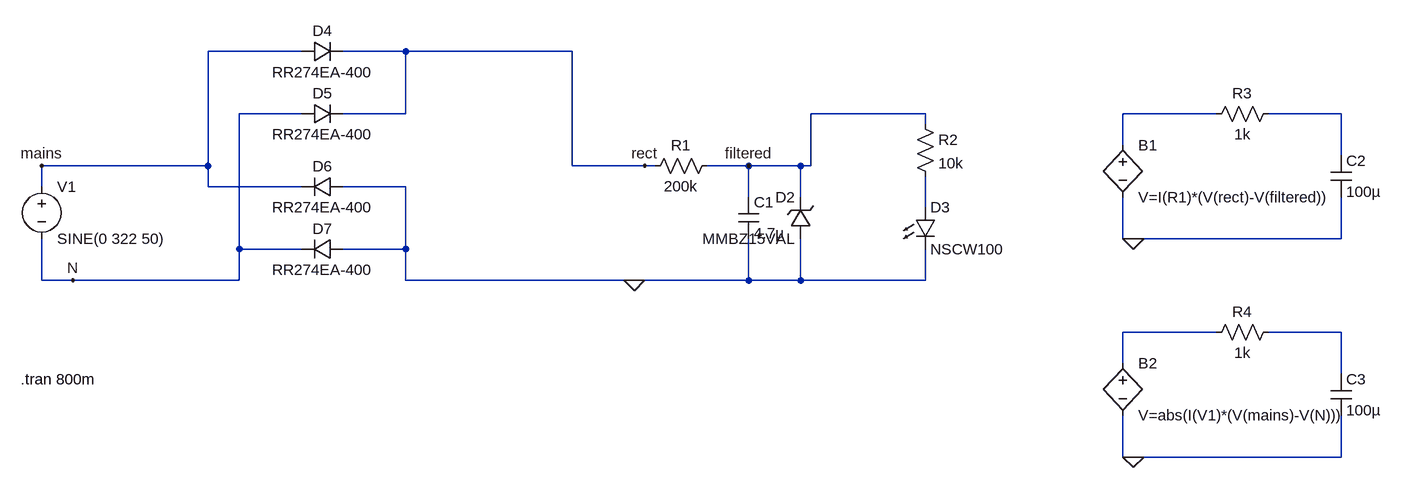
[diagram p0: schematic led_indicator_230v.asc]
led_indicator_230v.asc, the LTspice schematic file:
Version 4
SHEET 1 1312 680
WIRE -352 -80 -496 -80
WIRE -192 -80 -288 -80
WIRE 64 -80 -192 -80
WIRE -352 16 -448 16
WIRE -192 16 -192 -80
WIRE -192 16 -288 16
WIRE 608 16 432 16
WIRE 1056 16 912 16
WIRE 1248 16 1136 16
WIRE 608 32 608 16
WIRE 912 64 912 16
WIRE 1248 80 1248 16
WIRE -496 96 -496 -80
WIRE -496 96 -752 96
WIRE 64 96 64 -80
WIRE 176 96 64 96
WIRE 192 96 176 96
WIRE 336 96 272 96
WIRE 416 96 336 96
WIRE 432 96 432 16
WIRE 432 96 416 96
WIRE -752 128 -752 96
WIRE -496 128 -496 96
WIRE -352 128 -496 128
WIRE -192 128 -288 128
WIRE 336 144 336 96
WIRE 416 144 416 96
WIRE 608 160 608 112
WIRE 912 208 912 144
WIRE 928 208 912 208
WIRE 1248 208 1248 144
WIRE 1248 208 928 208
WIRE -448 224 -448 16
WIRE -352 224 -448 224
WIRE -192 224 -192 128
WIRE -192 224 -288 224
WIRE -752 272 -752 208
WIRE -704 272 -752 272
WIRE -448 272 -448 224
WIRE -448 272 -704 272
WIRE -192 272 -192 224
WIRE 160 272 -192 272
WIRE 336 272 336 208
WIRE 336 272 160 272
WIRE 416 272 416 208
WIRE 416 272 336 272
WIRE 608 272 608 224
WIRE 608 272 416 272
WIRE 1056 352 912 352
WIRE 1248 352 1136 352
WIRE 912 400 912 352
WIRE 1248 416 1248 352
WIRE 912 544 912 480
WIRE 928 544 912 544
WIRE 1248 544 1248 480
WIRE 1248 544 928 544
FLAG 160 272 0
FLAG 928 208 0
FLAG -752 96 mains
FLAG 336 96 filtered
FLAG 176 96 rect
FLAG 928 544 0
FLAG -704 272 N
SYMBOL res 176 112 R270
WINDOW 0 32 56 VTop 2
WINDOW 3 0 56 VBottom 2
SYMATTR InstName R1
SYMATTR Value 200k
SYMBOL cap 320 144 R0
SYMATTR InstName C1
SYMATTR Value 4.7µ
SYMBOL LED 592 160 R0
SYMATTR InstName D3
SYMATTR Value NSCW100
SYMBOL voltage -752 112 R0
WINDOW 123 0 0 Left 2
WINDOW 39 0 0 Left 2
SYMATTR InstName V1
SYMATTR Value SINE(0 322 50)
SYMBOL res 592 16 R0
SYMATTR InstName R2
SYMATTR Value 10k
SYMBOL zener 432 208 R180
WINDOW 0 24 64 Left 2
WINDOW 3 24 0 Left 2
SYMATTR InstName D2
SYMATTR Value MMBZ15VAL
SYMBOL bv 912 48 R0
SYMATTR InstName B1
SYMATTR Value V=I(R1)*(V(rect)-V(filtered))
SYMBOL res 1152 0 R90
WINDOW 0 0 56 VBottom 2
WINDOW 3 32 56 VTop 2
SYMATTR InstName R3
SYMATTR Value 1k
SYMBOL cap 1232 80 R0
SYMATTR InstName C2
SYMATTR Value 100µ
SYMBOL bv 912 384 R0
SYMATTR InstName B2
SYMATTR Value V=abs(I(V1)*(V(mains)-V(N)))
SYMBOL res 1152 336 R90
WINDOW 0 0 56 VBottom 2
WINDOW 3 32 56 VTop 2
SYMATTR InstName R4
SYMATTR Value 1k
SYMBOL cap 1232 416 R0
SYMATTR InstName C3
SYMATTR Value 100µ
SYMBOL diode -352 -64 R270
WINDOW 0 32 32 VTop 2
WINDOW 3 0 32 VBottom 2
SYMATTR InstName D4
SYMATTR Value RR274EA-400
SYMBOL diode -352 32 R270
WINDOW 0 32 32 VTop 2
WINDOW 3 0 32 VBottom 2
SYMATTR InstName D5
SYMATTR Value RR274EA-400
SYMBOL diode -288 112 R90
WINDOW 0 0 32 VBottom 2
WINDOW 3 32 32 VTop 2
SYMATTR InstName D6
SYMATTR Value RR274EA-400
SYMBOL diode -288 208 R90
WINDOW 0 0 32 VBottom 2
WINDOW 3 32 32 VTop 2
SYMATTR InstName D7
SYMATTR Value RR274EA-400
TEXT -784 424 Left 2 !.tran 800m

The netlist it stands for:
* led_indicator_230v.asc
R1 rect filtered 200k
C1 filtered 0 4.7µ
D3 N003 0 NSCW100
V1 mains N SINE(0 322 50)
R2 filtered N003 10k
D2 0 filtered MMBZ15VAL
B1 N001 0 V=I(R1)*(V(rect)-V(filtered))
R3 N002 N001 1k
C2 N002 0 100µ
B2 N004 0 V=abs(I(V1)*(V(mains)-V(N)))
R4 N005 N004 1k
C3 N005 0 100µ
D4 mains rect RR274EA-400
D5 N rect RR274EA-400
D6 0 mains RR274EA-400
D7 0 N RR274EA-400
.model D D
.lib standard.dio
.tran 800m
.backanno
.end